# Altium schematic sheet AD592BNZ.SchDoc: AD592BNZ
size 410 x 297 mm; ApprovedBy: Стерхов В.Д.; CheckedBy: Стерхов В.Д.; Author: Сергеев Д.А.; CompanyName: ГК "СНАБЖЕНИЕ"; DrawnBy: Сергеев Д.А.; Engineer: Сергеев Д.А.; Organization: ГК "СНАБЖЕНИЕ"; DocumentNumber: AD592BNZ; SheetNumber: 1; SheetTotal: 1
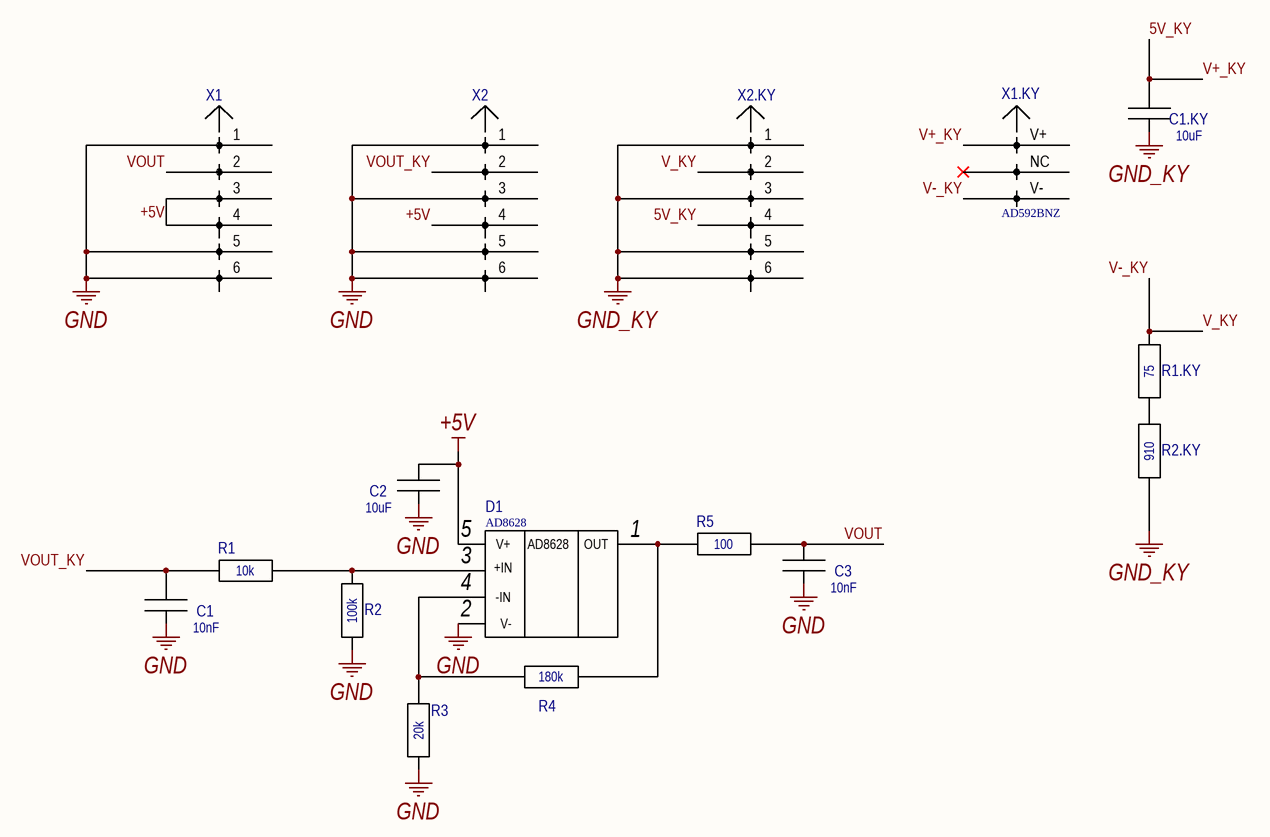
[diagram p0: AD592BNZ.SchDoc]

## Parts
C1  10nF  [0805]
C1.KY  10uF  [0805]
C2  10uF  [0805]
C3  10nF  [0805]
D1  AD8628  [SOT-23-5]
R1  10k  [0805]
R1.KY  75  [0805]
R2  100k  [0805]
R2.KY  910  [0805]
R3  20k  [0805]
R4  180k  [0805]
R5  100  [0805]
X1  PLD6-2,54  [PLD6-2,54]  (value not drawn)
X1.KY  AD592BNZ  [AD592]
X2  PLD6-2,54  [PLD6-2,54]  (value not drawn)
X2.KY  PLD6-2,54  [PLD6-2,54]  (value not drawn)

## Nets
+5V: C2.1 D1.5 X1.3 X1.4 X2.4
GND: C1.2 C2.2 C3.2 D1.2 R2.1 R3.2 X1.1 X1.5 X1.6 X2.1 X2.3 X2.5 X2.6
GND_KY: C1.KY.2 R2.KY.1 X2.KY.1 X2.KY.3 X2.KY.5 X2.KY.6
5V_KY: C1.KY.1 X1.KY.1 X2.KY.4  [also labelled V+_KY]
V-_KY: R1.KY.2 X1.KY.3 X2.KY.2  [also labelled V_KY]
VOUT: C3.1 R5.1 X1.2
VOUT_KY: C1.1 R1.2 X2.2
NetD1_1: D1.1 R4.1 R5.2
NetD1_3: D1.3 R1.1 R2.2
NetD1_4: D1.4 R3.1 R4.2
NetR1.KY_1: R1.KY.1 R2.KY.2

Not connected (* = marked no-connect by the designer): X1.KY 2*

## Notes on the sheet
- Перв. примен.
- Справ. №
- Подп. и дата
- Инв. № дубл.
- Взам. инв. №
- Разраб.
- Изм.
- Лист
- № докум.
- Подп.
- Дата
- Литера
- Масса
- Масштаб
- Пров.
- Т.контр.
- Листов
- Инв. № подл.
- Н.контр.
- Утв.
- Форма 1 ГОСТ 2.104-2006
- Копировал
- Формат А3
- (in symbol AD592BNZ) V+; NC; V-
- (in symbol AD8628) V+; OUT; +IN; -IN; V-

## Library data of the parts
C1 C1.KY C2 C3 = C0805: ComponentHeigt: 1.3; Firme: AVX; Leadform: SMD; KIND: Конденсатор; ClassName: *; Component Link: *; ComponentWeigt: *; Packaging: 0805; NN: *
  C1 C3: Value: 10nF
  C1.KY C2: Value: 10uF
R1 R1.KY R2 R2.KY R3-R5 = R0805 Yageo: ComponentHeigt: 0.6; Firme: Yageo; Leadform: SMD; Kind: Резистор; ClassName: *; ComponentWeigt: *; Component Link: *; Packaging: 0805; NN: *
  R1: Value: 10k
  R1.KY: Value: 75
  R2: Value: 100k
  R2.KY: Value: 910
  R3: Value: 20k
  R4: Value: 180k
  R5: Value: 100
X1 X2 X2.KY = PLD6-2,54: ComponentHeigt: 5.5; Name: Вилка; Specification: Вилка PLD2-2 *; Typ: PLD2-2; ClassName: *; Component Link: *; ComponentWeigt: *; Firme: *; Leadform: *; NN: *; KIND: *